# Altium schematic sheet Schematic.schdoc
size 297 x 209 mm; Symbol: Drawing-Symbol_A4; @Project Name: sound_detector; @Page Count: 1; @Update Date: 2026-10-23; @Create Date: 2026-10-23; @Schematic Name: Schematic1; @Page No: 1; @Page Name: P1; Company: Hack club; Version: V1.0; Page Size: A4; Drawn: Dipender singh; Device: Drawing-Symbol_A4; @Create Time: 20:51:14; @Update Time: 20:51:14; Border: 1; Width: 1170; Height: 825; Region Start: 1; X Region Count: 6; Y Region Count: 4; Blade Width: 10; Title Block Position: 3; @Board Name: Board1
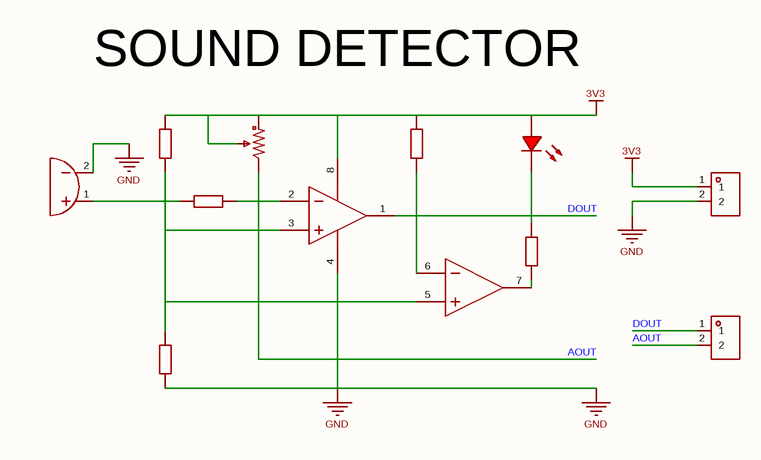
[diagram p0: Schematic.schdoc]

## Parts
LED1  (no value)  [LED-TH_BD3.0-P2.54-FD]
MIC1  GMI9767P-52DB  [MIC-TH_BD9.7-P2.54-D0.8-L-FD]  (value not drawn)
R1  10kΩ  [RES-ADJ-TH_3P-L10.0-W10.0-P2.50-L]  (value not drawn)
R2  10kΩ  [R0603]  (value not drawn)
R3  10kΩ  [R0603]  (value not drawn)
R4  150Ω  [R0603]  (value not drawn)
R5  10kΩ  [R0603]  (value not drawn)
R6  10kΩ  [R0603]  (value not drawn)
U1  LM393PSR  [SOIC-8_L5.3-W5.3-P1.27-LS8.0-BL]  (value not drawn)  (parts A,B of 2)
U2  DB128V-5.0-2P-GY-S  [CONN-TH_DB128V-5.0-2P-XX]  (value not drawn)
U3  DB128V-5.0-2P-GY-S  [CONN-TH_DB128V-5.0-2P-XX]  (value not drawn)

## Nets
3V3: LED1.1(C) R1.1 R1.2 R2.1 R5.1 U1.8(+VS) U2.1
GND: MIC1.2 R3.2 U1.4(-VS) U2.2
AOUT: R1.3 R4.2 U1.2(INA-) U3.2
DOUT: R5.2 U1.1(OUTA) U1.6(INB-) U3.1
NetLED1_2: LED1.2(A) R6.1
NetMIC1_1: MIC1.1 R4.1
NetR2_2: R2.2 R3.1 U1.3(INA+) U1.5(INB+)
NetR6_2: R6.2 U1.7(OUTB)

## Notes on the sheet
- SOUND DETECTOR
- Create at
- 2026-10-23
- Schematic
- Board
- Schematic1
- Board1
- Update at
- Page
- P1
- Drawn
- Reviewed
- Dipender singh
- sound_detector
- Version
- V1.0
- Size
- A4
- Page  1  Total  1
- Hack club

## Library data of the parts
LED1 = LED_TH-R_3mm: ConvertToPcb: yes; ModelId: e27ad2b2b79e43aeb93d955d1fd765940819f05c4eef4c71ace90d822a990e87; ModelName: LED-TH-3mm_R; ModelTransform: 141.274,153.327,0,0,0,0,-5.984,0,-137.795; Symbol: LED_TH-R; Device: LED_TH-R_3mm; AddInBom: yes; FootprintName: LED-TH_BD3.0-P2.54-FD; Supplier Footprint: Through
MIC1 = GMI9767P-52DB: Voltage - Supply:4.5V Voltage - Supply:4.5V Current - Supply:500uA Direction:Omnidirectional Output Impedance:2.2kΩ S/N Ratio:58dB Sensitivity:-52dB Diameter(φD):9.7mm Height:6.7mm Operating Temperature:-20℃~+60℃ Operating Temperature:-20℃~+60℃ Mounting T; Manufacturer: INGHAi(赢海); AddInBom: yes; ModelId: f5ea411732774f5ab25106d967d9aae30819f05c4eef4c71ace90d822a990e87; ModelTransform: 381.889,381.13538,0,0,0,0,0,79.016,-118.11; Voltage - Supply: 4.5V; Current - Supply: 500uA; Output Impedance: 2.2kΩ; S/N Ratio: 58dB; Sensitivity: -52dB; Symbol: GMI9767P-52DB; Device: GMI9767P-52DB; LCSC Part Name: 全指向φ9.7*6.7mm 1.5V-10V 灵敏度-52db 低阻抗 针脚; SupplierPart: C234023; ManufacturerPart: GMI9767P-52DB; Supplier Footprint: 插件,D=9.7mm; JLCPCB Part Class: Extended Part; Datasheet: https://item.szlcsc.com/datasheet/GMI9767P-52DB/233805.html; Supplier: LCSC; ConvertToPcb: yes; FootprintName: MIC-TH_BD9.7-P2.54-D0.8-L-FD; ModelName: MIC-TH_BD9.7-P2.54-D0.8-L-FD; Direction: Omnidirectional; Diameter(φD): 9.7mm; Height: 6.7mm; Operating Temperature: -20℃~+60℃; Mounting Type: Plug-in; Lead Pitch: 2.54mm; Frequency Range: -
R1 = 3296W-1-103_C118954: Resistance:10kΩ Tolerance:±10% Tolerance:±10% Power(Watts):500mW Temperature Coefficient:±250ppm/℃ Temperature Coefficient:±250ppm/℃ Number of Turns:30; Manufacturer: BOCHEN(博晨); AddInBom: yes; ModelId: a6371091f24d4a5ea74165508c31d2ae0819f05c4eef4c71ace90d822a990e87; ModelName: 3296W; ModelTransform: 374.015,188.976,0,180,0,0,0,0,-137.795; Tolerance: ±10%; Power(Watts): 500mW; Number of Turns: 30; Symbol: 3296W-1-103; Device: 3296W-1-103_C118954; LCSC Part Name: 10kΩ ±10%; SupplierPart: C118954; ManufacturerPart: 3296W-1-103; Supplier Footprint: 插件-3P,9.5x4.9mm; JLCPCB Part Class: Extended Part; Datasheet: https://item.szlcsc.com/datasheet/3296W-1-103/120223.html; Supplier: LCSC; ConvertToPcb: yes; FootprintName: RES-ADJ-TH_3P-L10.0-W10.0-P2.50-L; Value: 10kΩ; Temperature Coefficient: ±250ppm/℃
R2 R3 R5 R6 = 0603WAF1002T5E: Type:Thick Film Resistor Resistance:10kΩ Tolerance:±1% Tolerance:±1% Power(Watts):100mW Voltage-Supply(Max):75V Temperature Coefficient:±100ppm/℃ Temperature Coefficient:±100ppm/℃ Operating Temperature:-55℃~+155℃ Operating Temperature:-55℃~+155℃; Manufacturer: UNI-ROYAL(厚声); AddInBom: yes; ModelId: 112863783b5b41f1b5254f87eedc79320819f05c4eef4c71ace90d822a990e87; ModelTransform: 31.8897,63.7794,0,90,0,0,0,0,0; Tolerance: ±1%; Power(Watts): 100mW; Voltage-Supply(Max): 75V; Symbol: 0603WAF1002T5E; Device: 0603WAF1002T5E; LCSC Part Name: 厚膜电阻 10kΩ ±1% 100mW; SupplierPart: C25804; ManufacturerPart: 0603WAF1002T5E; Supplier Footprint: 0603; JLCPCB Part Class: Basic Part; Datasheet: https://item.szlcsc.com/datasheet/0603WAF1002T5E/26547.html; Supplier: LCSC; ConvertToPcb: yes; FootprintName: R0603; ModelName: R0603; Type: Thick Film Resistor; Value: 10kΩ; Temperature Coefficient: ±100ppm/℃; Operating Temperature: -55℃~+155℃
R4 = FRC0603J151 TS: Type:Thick Film Resistor Resistance:150Ω Tolerance:±5% Tolerance:±5% Power(Watts):100mW Voltage-Supply(Max):75V Temperature Coefficient:±100ppm/℃ Temperature Coefficient:±100ppm/℃ Operating Temperature:-55℃~+155℃ Operating Temperature:-55℃~+155℃; Manufacturer: FOJAN(富捷); AddInBom: yes; ModelId: 112863783b5b41f1b5254f87eedc79320819f05c4eef4c71ace90d822a990e87; ModelTransform: 31.8897,63.7794,0,90,0,0,0,0,0; Tolerance: ±5%; Power(Watts): 100mW; Voltage-Supply(Max): 75V; Symbol: FRC0603J151 TS; Device: FRC0603J151 TS; LCSC Part Name: 150Ω ±5% 100mW 厚膜电阻; SupplierPart: C2907103; ManufacturerPart: FRC0603J151 TS; Supplier Footprint: 0603; JLCPCB Part Class: Extended Part; Supplier: LCSC; ConvertToPcb: yes; FootprintName: R0603; ModelName: R0603; Type: Thick Film Resistor; Value: 150Ω; Temperature Coefficient: ±100ppm/℃; Operating Temperature: -55℃~+155℃
U1 = LM393PSR: Number of Channels:2 Vos - Input Offset Voltage:370uV Ib - Input Bias Current:3.5nA Propagation Delay Time:1us Input Hysteresis Voltage (Vhys):- Common Mode Rejection Ratio(CMRR):- Output Type:Open-drain Output Mode:TTL；CMOS Quiescent Current:400uA Operat; Manufacturer: TI(德州仪器); Relevance: []; AddInBom: yes; ModelId: 7b3104f4a302484e875593c5ba7bd3db0819f05c4eef4c71ace90d822a990e87; ModelName: SOIC-8_L5.3-W5.3-H1.9-LS7.9-P1.27; ModelTransform: 208.661,311.25654,0,0,0,0,-0.0005,0.0005,0; Number of Channels: 2; Vos - Input Offset Voltage: 370uV; Ib - Input Bias Current: 3.5nA; Propagation Delay Time: 1us; Quiescent Current: 400uA; Maximum Power Supply Range (Vdd-Vss): 36V; Single Supply: 2V~30V; Input Offset Current(Ios): 0.5nA; Symbol: LM393PSR; Device: LM393PSR; LCSC Part Name: 双路比较器; SupplierPart: C2878752; ManufacturerPart: LM393PSR; Supplier Footprint: SOIC-8-208mil; JLCPCB Part Class: Extended Part; Datasheet: https://www.ti.com/cn/lit/gpn/lm393a; Supplier: LCSC; ConvertToPcb: yes; FootprintName: SOIC-8_L5.3-W5.3-P1.27-LS8.0-BL; Input Hysteresis Voltage (Vhys): -; Common Mode Rejection Ratio(CMRR): -; Output Type: Open-drain; Output Mode: TTL；CMOS; Operating Temperature: -40℃~+85℃; Response Time (tr): 1us; Features: -
U2 U3 = DB128V-5.0-2P-GY-S: Number of Positions or Pins:1x2P Pitch:5mm Color:Gray Mounting Type:Through Hole Number of Pins:2P Number of Rows:1 Number of PINs Per Row:2 Screw Specification:M2.5 Current Rating:16A Voltage Rating (Max):300V Wire Gauge - AWG:12~22 Wire Gauge - mm2:2.5; Manufacturer: DORABO(地博电气); Symbol: DB128V-5.0-2P-GR; AddInBom: yes; ModelId: 85a3d91cc16f4e848d0d1cc41dd56b900819f05c4eef4c71ace90d822a990e87; ModelTransform: 413.385,405.511,0,0,0,0,-12.362,-9.843,-137.795; Number of Positions or Pins: 1x2P; Pitch: 5mm; Number of PINs Per Row: 2; Screw Specification: M2.5; Current Rating: 16A; Voltage Rating (Max): 300V; Wire Gauge - AWG: 12~22; Wire Gauge - mm2: 2.5; Device: DB128V-5.0-2P-GY-S; LCSC Part Name: 1x2P 5mm 直插 排数:1 每排P数:2; SupplierPart: C424693; ManufacturerPart: DB128V-5.0-2P-GY-S; Supplier Footprint: 插件,P=5mm; JLCPCB Part Class: Extended Part; Datasheet: https://item.szlcsc.com/datasheet/DB128V-5.0-2P-GY-S/418362.html; Supplier: LCSC; ConvertToPcb: yes; FootprintName: CONN-TH_DB128V-5.0-2P-XX; ModelName: CONN-TH_DB128V-5.0-2P-XX; Color: Gray; Mounting Type: Through Hole; Number of Pins: 2P; Number of Rows: 1; Operating Temperature: -40℃~+105℃; Height Above Board: 14mm